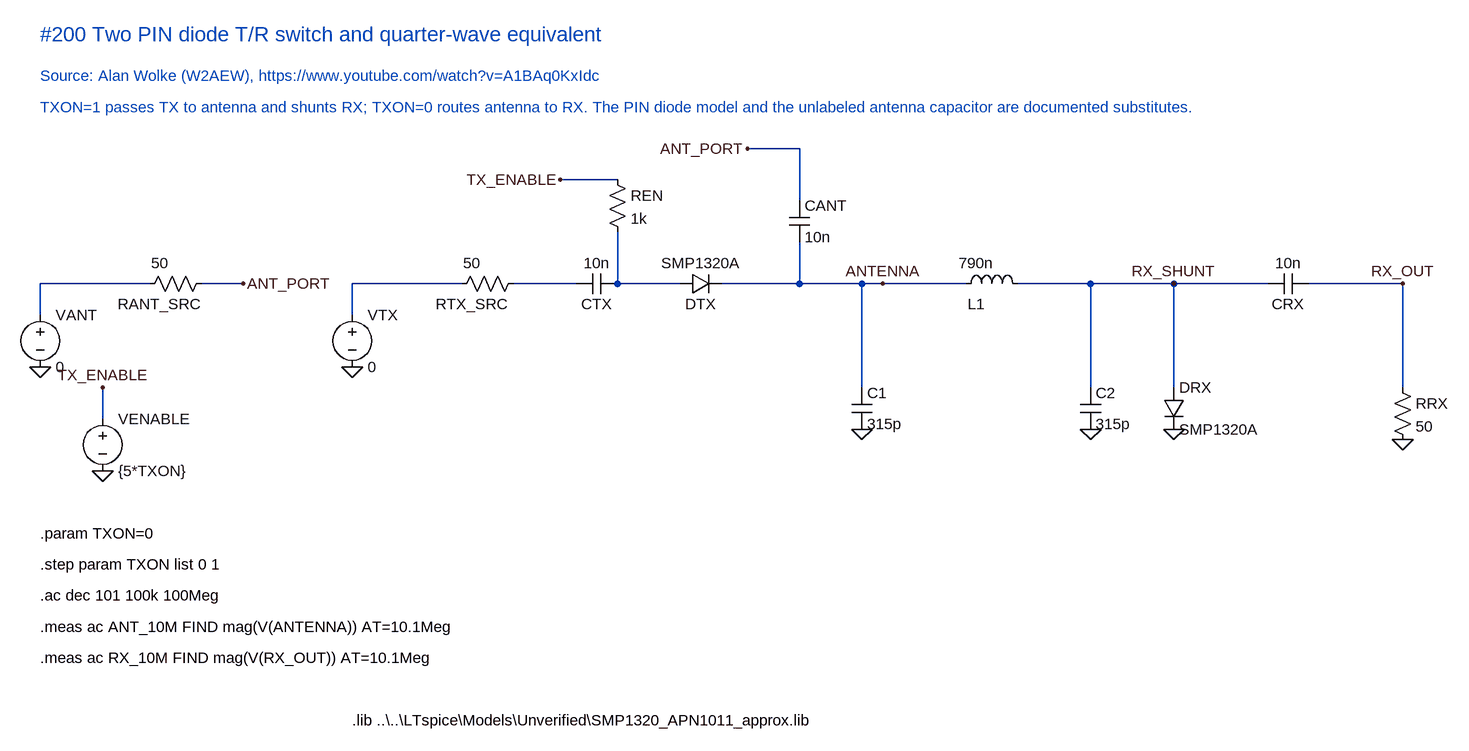
[diagram p0: schematic Two PIN diode T R switch.asc]
Two PIN diode T R switch.asc, the LTspice schematic file:
Version 4.1
SHEET 1 2112 1040
WIRE -480 0 -480 48
WIRE -312 0 -480 0
WIRE -384 160 -384 208
WIRE -168 0 -232 0
WIRE 320 -160 408 -160
WIRE 0 0 0 48
WIRE 168 0 0 0
WIRE 344 0 248 0
WIRE 504 0 408 0
WIRE 408 0 408 -80
WIRE 568 0 688 0
WIRE 688 0 688 -64
WIRE 608 -208 688 -208
WIRE 688 -128 688 -208
WIRE 784 0 688 0
WIRE 944 0 784 0
WIRE 1136 0 1024 0
WIRE 1264 0 1136 0
WIRE 1408 0 1264 0
WIRE 1616 0 1472 0
WIRE 784 160 784 0
WIRE 1136 160 1136 0
WIRE 1264 160 1264 0
WIRE 1616 160 1616 0
FLAG -480 128 0
FLAG -384 288 0
FLAG 0 128 0
FLAG -168 0 ANT_PORT
FLAG -384 160 TX_ENABLE
FLAG 320 -160 TX_ENABLE
FLAG 608 -208 ANT_PORT
FLAG 784 224 0
FLAG 1136 224 0
FLAG 1264 224 0
FLAG 1616 240 0
FLAG 816 0 ANTENNA
FLAG 1264 0 RX_SHUNT
FLAG 1616 0 RX_OUT
SYMBOL voltage -480 32 R0
SYMATTR InstName VANT
SYMATTR Value 0
SYMATTR Value2 AC {1-TXON}
SYMBOL voltage -384 192 R0
SYMATTR InstName VENABLE
SYMATTR Value {5*TXON}
SYMBOL voltage 0 32 R0
SYMATTR InstName VTX
SYMATTR Value 0
SYMATTR Value2 AC {TXON}
SYMBOL res -328 16 R270
WINDOW 0 0 32 VBottom 2
WINDOW 3 32 32 VTop 2
SYMATTR InstName RANT_SRC
SYMATTR Value 50
SYMBOL res 152 16 R270
WINDOW 0 0 32 VBottom 2
WINDOW 3 32 32 VTop 2
SYMATTR InstName RTX_SRC
SYMATTR Value 50
SYMBOL cap 344 16 R270
WINDOW 0 0 32 VBottom 2
WINDOW 3 32 32 VTop 2
SYMATTR InstName CTX
SYMATTR Value 10n
SYMBOL res 392 -176 R0
SYMATTR InstName REN
SYMATTR Value 1k
SYMBOL diode 504 16 R270
WINDOW 0 0 32 VBottom 2
WINDOW 3 32 32 VTop 2
SYMATTR InstName DTX
SYMATTR Value SMP1320A
SYMBOL cap 672 -128 R0
SYMATTR InstName CANT
SYMATTR Value 10n
SYMBOL cap 768 160 R0
SYMATTR InstName C1
SYMATTR Value 315p
SYMBOL ind 928 16 R270
WINDOW 0 0 32 VBottom 2
WINDOW 3 32 32 VTop 2
SYMATTR InstName L1
SYMATTR Value 790n
SYMBOL cap 1120 160 R0
SYMATTR InstName C2
SYMATTR Value 315p
SYMBOL diode 1248 160 R0
SYMATTR InstName DRX
SYMATTR Value SMP1320A
SYMBOL cap 1408 16 R270
WINDOW 0 0 32 VBottom 2
WINDOW 3 32 32 VTop 2
SYMATTR InstName CRX
SYMATTR Value 10n
SYMBOL res 1600 144 R0
SYMATTR InstName RRX
SYMATTR Value 50
TEXT -480 -384 Left 3 ;#200 Two PIN diode T/R switch and quarter-wave equivalent
TEXT -480 -320 Left 2 ;Source: Alan Wolke (W2AEW), https://www.youtube.com/watch?v=A1BAq0KxIdc
TEXT -480 -272 Left 2 ;TXON=1 passes TX to antenna and shunts RX; TXON=0 routes antenna to RX. The PIN diode model and the unlabeled antenna capacitor are documented substitutes.
TEXT -480 384 Left 2 !.param TXON=0
TEXT -480 432 Left 2 !.step param TXON list 0 1
TEXT -480 480 Left 2 !.ac dec 101 100k 100Meg
TEXT -480 528 Left 2 !.meas ac ANT_10M FIND mag(V(ANTENNA)) AT=10.1Meg
TEXT -480 576 Left 2 !.meas ac RX_10M FIND mag(V(RX_OUT)) AT=10.1Meg
TEXT 0 672 Left 2 !.lib ..\..\LTspice\Models\Unverified\SMP1320_APN1011_approx.lib

The netlist it stands for:
* Two PIN diode T R switch.asc
VANT N001 0 0 AC {1-TXON}
VENABLE TX_ENABLE 0 {5*TXON}
VTX N002 0 0 AC {TXON}
RANT_SRC N001 ANT_PORT 50
RTX_SRC N002 N003 50
CTX N003 N004 10n
REN TX_ENABLE N004 1k
DTX N004 ANTENNA SMP1320A
CANT ANT_PORT ANTENNA 10n
C1 ANTENNA 0 315p
L1 ANTENNA RX_SHUNT 790n
C2 RX_SHUNT 0 315p
DRX RX_SHUNT 0 SMP1320A
CRX RX_SHUNT RX_OUT 10n
RRX RX_OUT 0 50
.model D D
.lib standard.dio
* #200 Two PIN diode T/R switch and quarter-wave equivalent
* Source: Alan Wolke (W2AEW), https://www.youtube.com/watch?v=A1BAq0KxIdc
* TXON=1 passes TX to antenna and shunts RX; TXON=0 routes antenna to RX. The PIN diode model and the unlabeled antenna capacitor are documented substitutes.
.param TXON=0
.step param TXON list 0 1
.ac dec 101 100k 100Meg
.meas ac ANT_10M FIND mag(V(ANTENNA)) AT=10.1Meg
.meas ac RX_10M FIND mag(V(RX_OUT)) AT=10.1Meg
.lib ..\..\LTspice\Models\Unverified\SMP1320_APN1011_approx.lib
.backanno
.end